# Altium schematic sheet MIPI_Sheet.SchDoc
size A4; DocumentNumber: 15; SheetNumber: 15; SheetTotal: 27
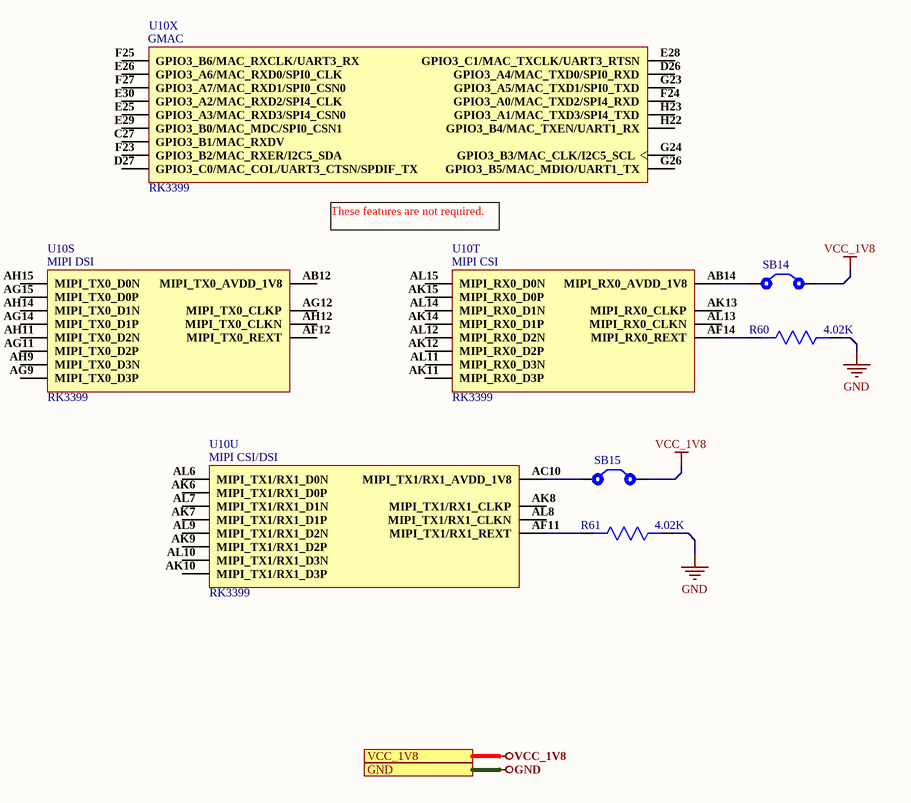
[diagram p0: MIPI_Sheet.SchDoc]

## Parts
R60  4.02K  [Res0603]
R61  4.02K  [Res0603]
SB14  Solder Bridge  [Solder Bridge]  (value not drawn)
SB15  Solder Bridge  [Solder Bridge]  (value not drawn)
U10  RK3399  [RK3399]  (parts S,T,U,X of 34)

## Ports
GND, VCC_1V8

## Nets
GND: R60.1 R61.1 ; port GND
VCC_1V8: SB14.2 SB15.2 ; port VCC_1V8
NetR60_2: R60.2 U10.AF14(MIPI_RX0_REXT)
NetR61_2: R61.2 U10.AF11(MIPI_TX1/RX1_REXT)
NetSB14_1: SB14.1 U10.AB14(MIPI_RX0_AVDD_1V8)
NetSB15_1: SB15.1 U10.AC10(MIPI_TX1/RX1_AVDD_1V8)

Not connected (* = marked no-connect by the designer): U10 AB12(MIPI_TX0_AVDD_1V8) AF12(MIPI_TX0_REXT) AG9(MIPI_TX0_D3P) AG11(MIPI_TX0_D2P) AG12(MIPI_TX0_CLKP) AG14(MIPI_TX0_D1P) AG15(MIPI_TX0_D0P) AH9(MIPI_TX0_D3N) AH11(MIPI_TX0_D2N) AH12(MIPI_TX0_CLKN) AH14(MIPI_TX0_D1N) AH15(MIPI_TX0_D0N) AK6(MIPI_TX1/RX1_D0P) AK7(MIPI_TX1/RX1_D1P) AK8(MIPI_TX1/RX1_CLKP) AK9(MIPI_TX1/RX1_D2P) AK10(MIPI_TX1/RX1_D3P) AK11(MIPI_RX0_D3P) AK12(MIPI_RX0_D2P) AK13(MIPI_RX0_CLKP) AK14(MIPI_RX0_D1P) AK15(MIPI_RX0_D0P) AL6(MIPI_TX1/RX1_D0N) AL7(MIPI_TX1/RX1_D1N) AL8(MIPI_TX1/RX1_CLKN) AL9(MIPI_TX1/RX1_D2N) AL10(MIPI_TX1/RX1_D3N) AL11(MIPI_RX0_D3N) AL12(MIPI_RX0_D2N) AL13(MIPI_RX0_CLKN) AL14(MIPI_RX0_D1N) AL15(MIPI_RX0_D0N) C27(GPIO3_B1/MAC_RXDV) D26(GPIO3_A4/MAC_TXD0/SPI0_RXD) D27(GPIO3_C0/MAC_COL/UART3_CTSN/SPDIF_TX) E25(GPIO3_A3/MAC_RXD3/SPI4_CSN0) E26(GPIO3_A6/MAC_RXD0/SPI0_CLK) E28(GPIO3_C1/MAC_TXCLK/UART3_RTSN) E29(GPIO3_B0/MAC_MDC/SPI0_CSN1) E30(GPIO3_A2/MAC_RXD2/SPI4_CLK) F23(GPIO3_B2/MAC_RXER/I2C5_SDA) F24(GPIO3_A0/MAC_TXD2/SPI4_RXD) F25(GPIO3_B6/MAC_RXCLK/UART3_RX) F27(GPIO3_A7/MAC_RXD1/SPI0_CSN0) G23(GPIO3_A5/MAC_TXD1/SPI0_TXD) G24(GPIO3_B3/MAC_CLK/I2C5_SCL) G26(GPIO3_B5/MAC_MDIO/UART1_TX) H22(GPIO3_B4/MAC_TXEN/UART1_RX) H23(GPIO3_A1/MAC_TXD3/SPI4_TXD)

## Notes on the sheet
- (near U10) These features are not required.
- 1
- Huzaifa Ali
- (in symbol RK3399, part S) MIPI DSI
- (in symbol RK3399, part T) MIPI CSI
- (in symbol RK3399, part U) MIPI CSI/DSI
- (in symbol RK3399, part X) GMAC

## Library data of the parts
R60 R61 = 0603WAF4021T5E: 4.02kΩ 0603 Chip Resistor - Surface Mount ROHS; Manufcaturer: UNI-ROYAL; Manufcaturer Part Number: 0603WAF4021T5E; Footprint: 0603; ComponentLink1Description: LCSC; ComponentLink1URL: https://www.lcsc.com/product-detail/Chip-span-style-background-color-ff0-Resistor-span-Surface-Mount_UNI-ROYAL-Uniroyal-Elec-0603WAF4021T5E_C23040.html
SB14 SB15 = Solder Bridge: Solder Bridge ON
U10 = RK3399: RK3399 CPU BGA for HD set-top box chip BGA Chipse; Manufacturer: Fuzhou Rockchip Electronics; ComponentLink1Description: Aliexpress; ComponentLink1URL: https://www.aliexpress.com/item/1005001971093459.html?spm=a2g0n.productlist.0.0.3c7csv8Qsv8Quh&browser_id=3ac7e9efb8074641aaabc4d871f09748&aff_trace_key=&aff_platform=msite&m_page_id=181389a08711fc2600d8cc522bab8d702dd4189be0&gclid=&pdp_npi=2%40dis%21USD%21%2123.6%21%21%21%21%21%402101d91e16545120399167831e8b89%21%21sea&algo_pvid=4303aedd-774c-4013-953d-920f10b55003; Manufacturer Part Number: RK3399; Footprint: FCBGA828